# Altium project MAX976(SO uMAX).PrjPcb
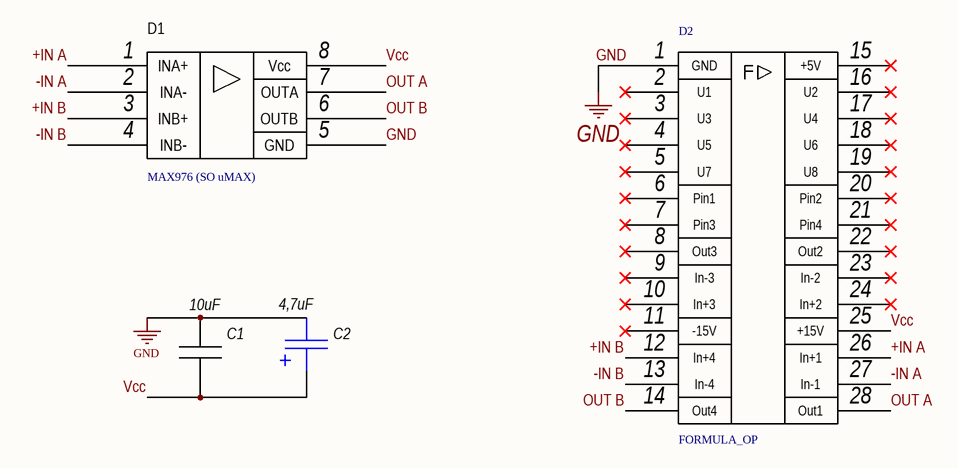
[diagram p0: MAX976.SchDoc]
1 sheet, 4 parts. Net scope: global (net labels, ports and power ports of the same name join across sheets).

## Sheet MAX976.SchDoc: =GlobalProjectName
size 410 x 297 mm; ApprovedBy: Утвердил; CheckedBy: Проверил; Author: Разработал; SheetNumber: 1; SheetTotal: 1; PageSetup: Record=PageOptions|CenterHorizontal=True|CenterVertical=True|PrintScale=1.00|XCorrection=1.00|YCorrection=1.00|PrintKind=1|BorderSize=5000000|LeftOffset=0|BottomOffset=0|Orientation=2|PaperLength=1000|PaperWidth=1000|Scale=100|PaperSource=15|PrintQuality=1200|MediaType=1|DitherType=10|PaperKind=A3|PrintScaleMode=1; Weight: -; ScaleFactor: -; NormInspection: Норм.Контр.

### Parts
C1  10uF  [0805]
C2  4,7uF  [TAJA]
D1  MAX976 (SO uMAX)  [SSOP to DIP8]
D2  FORMULA_OP  [Formula OY]

### Nets
GND: C1.1 C2.2 D1.5 D2.1
+IN A: D1.1 D2.26
+IN B: D1.3 D2.12
-IN A: D1.2 D2.27
-IN B: D1.4 D2.13
OUT A: D1.7 D2.28
OUT B: D1.6 D2.14
Vcc: C1.2 C2.1 D1.8 D2.25

Not connected (* = marked no-connect by the designer): D2 2* 3* 4* 5* 6* 7* 8* 9* 10* 11* 15* 16* 17* 18* 19* 20* 21* 22* 23* 24*

### Notes on the sheet
- Перв. примен.
- Справ. №
- Подп. и дата
- Инв. № дубл.
- Взам. инв. №
- Разраб.
- Изм.
- Лист
- № докум.
- Подп.
- Дата
- Литера
- Масса
- Масштаб
- Пров.
- Т.контр.
- Листов
- Инв. № подл.
- Н.контр.
- Утв.
- Форма 1 ГОСТ 2.104-2006
- Копировал
- Формат А3
- (in symbol FORMULA_OP) GND; +5V; U1; U2; U3; U4; U5; U6; U7; U8; Pin1; Pin2; Pin3; Pin4; Out3; Out2; In-3; In-2; In+3; In+2; -15V; +15V; In+4; In+1; In-4; In-1; Out4; Out1
- (in symbol MAX976 (SO uMAX)) INA+; Vcc; INA-; OUTA; INB+; OUTB; INB-; GND

### Library data of the parts
C1 = Cap (0805) AVX: ComponentHeigt: 1.3; Firme: AVX; Leadform: SMD; KIND: Конденсатор; ClassName: *; Component Link: *; ComponentWeigt: *; Packaging: 0805; NN: *; Value: *
C2 = 293D475X9010A2TE3: Manufacturer: Vishay Intertechnology; Type: Конденсатор; ID: 7; Value: 4.7uF; Voltage: 10V; Tolerance: ±10%; ESR: 5ohm; Published: 23.04.2010; Publisher: Andrew Danich; Part Number: 293D475X9010A2TE3; Footprint: A